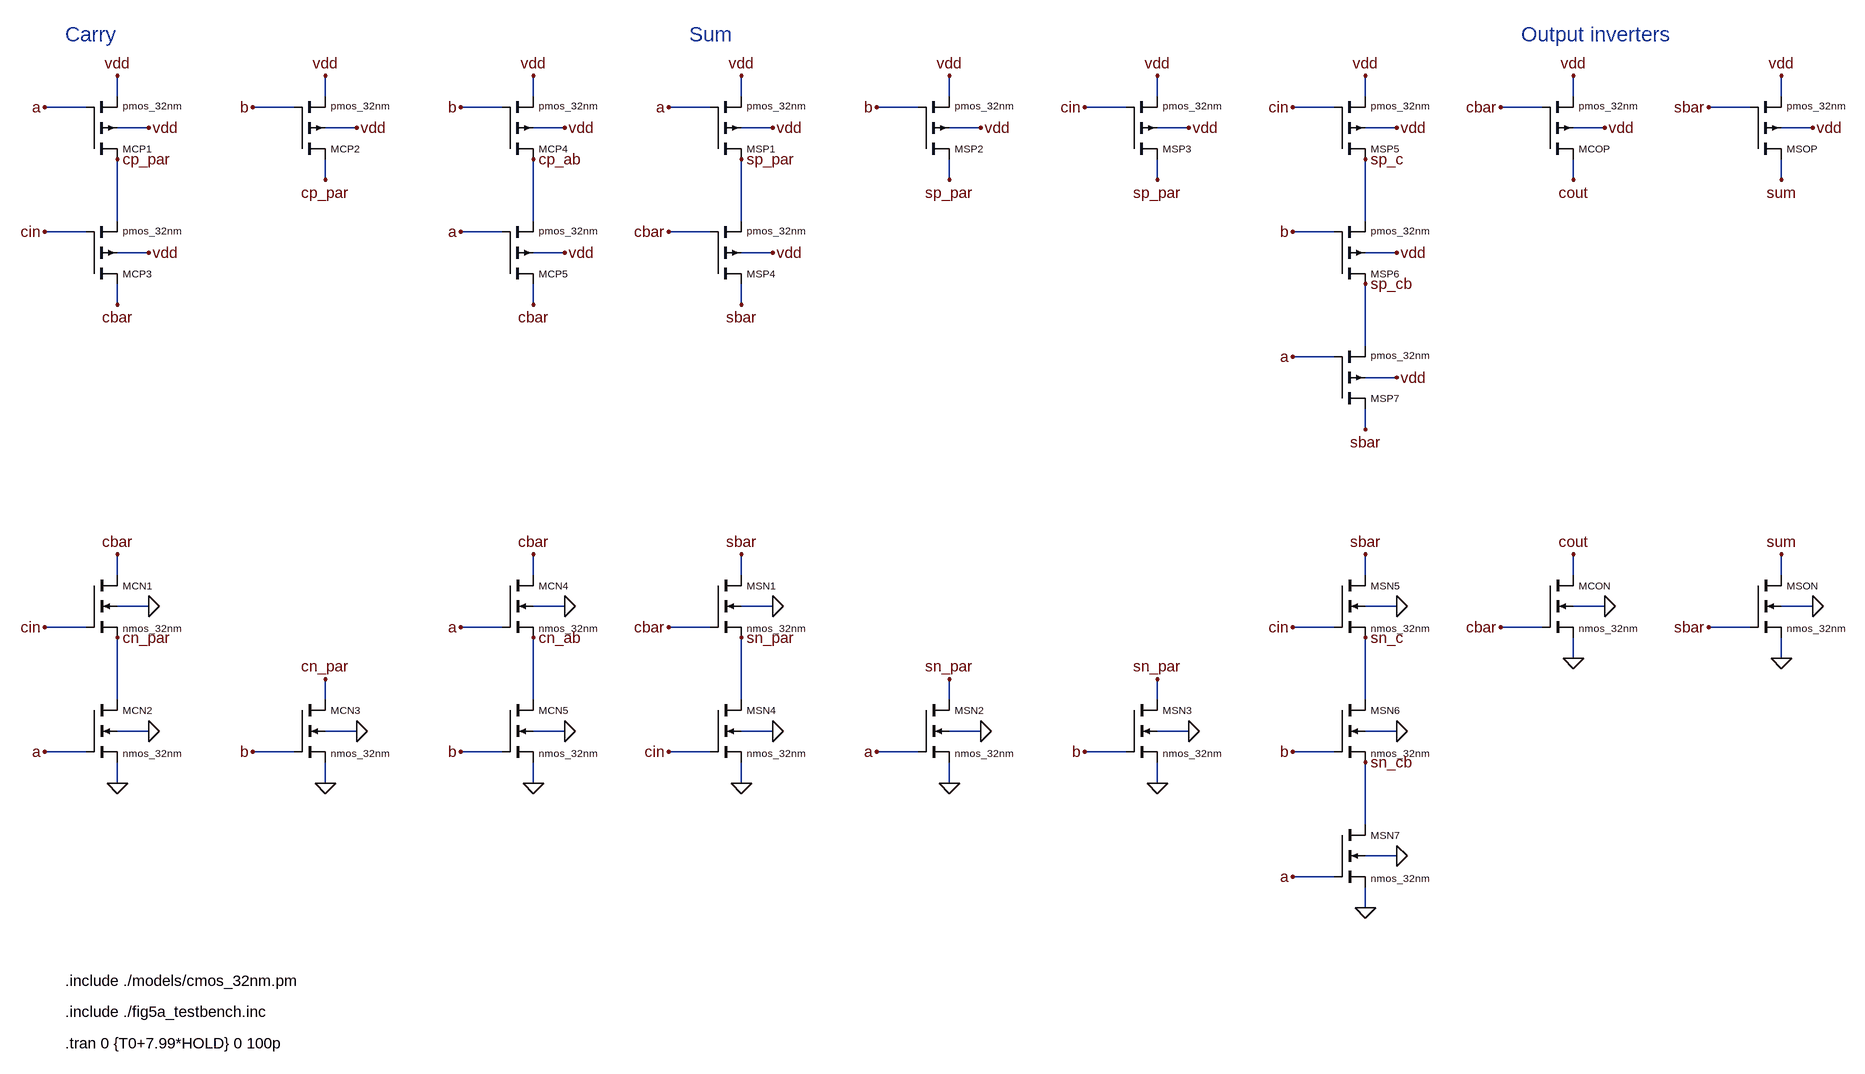
[diagram p0: schematic full_adder_28fet.asc]
full_adder_28fet.asc, the LTspice schematic file:
Version 4
SHEET 1 3040 1672
WIRE 80 144 16 144
WIRE 176 176 128 176
WIRE 128 128 128 96
WIRE 80 336 16 336
WIRE 176 368 128 368
WIRE 128 320 128 224
WIRE 128 448 128 416
WIRE 80 944 16 944
WIRE 176 912 128 912
WIRE 128 864 128 832
WIRE 80 1136 16 1136
WIRE 176 1104 128 1104
WIRE 128 1056 128 960
WIRE 128 1184 128 1152
WIRE 400 144 336 144
WIRE 496 176 448 176
WIRE 448 128 448 96
WIRE 448 256 448 224
WIRE 400 1136 336 1136
WIRE 496 1104 448 1104
WIRE 448 1056 448 1024
WIRE 448 1184 448 1152
WIRE 720 144 656 144
WIRE 816 176 768 176
WIRE 768 128 768 96
WIRE 720 336 656 336
WIRE 816 368 768 368
WIRE 768 320 768 224
WIRE 768 448 768 416
WIRE 720 944 656 944
WIRE 816 912 768 912
WIRE 768 864 768 832
WIRE 720 1136 656 1136
WIRE 816 1104 768 1104
WIRE 768 1056 768 960
WIRE 768 1184 768 1152
WIRE 1040 144 976 144
WIRE 1136 176 1088 176
WIRE 1088 128 1088 96
WIRE 1040 336 976 336
WIRE 1136 368 1088 368
WIRE 1088 320 1088 224
WIRE 1088 448 1088 416
WIRE 1040 944 976 944
WIRE 1136 912 1088 912
WIRE 1088 864 1088 832
WIRE 1040 1136 976 1136
WIRE 1136 1104 1088 1104
WIRE 1088 1056 1088 960
WIRE 1088 1184 1088 1152
WIRE 1360 144 1296 144
WIRE 1456 176 1408 176
WIRE 1408 128 1408 96
WIRE 1408 256 1408 224
WIRE 1360 1136 1296 1136
WIRE 1456 1104 1408 1104
WIRE 1408 1056 1408 1024
WIRE 1408 1184 1408 1152
WIRE 1680 144 1616 144
WIRE 1776 176 1728 176
WIRE 1728 128 1728 96
WIRE 1728 256 1728 224
WIRE 1680 1136 1616 1136
WIRE 1776 1104 1728 1104
WIRE 1728 1056 1728 1024
WIRE 1728 1184 1728 1152
WIRE 2000 144 1936 144
WIRE 2096 176 2048 176
WIRE 2048 128 2048 96
WIRE 2000 336 1936 336
WIRE 2096 368 2048 368
WIRE 2048 320 2048 224
WIRE 2000 528 1936 528
WIRE 2096 560 2048 560
WIRE 2048 512 2048 416
WIRE 2048 640 2048 608
WIRE 2000 944 1936 944
WIRE 2096 912 2048 912
WIRE 2048 864 2048 832
WIRE 2000 1136 1936 1136
WIRE 2096 1104 2048 1104
WIRE 2048 1056 2048 960
WIRE 2000 1328 1936 1328
WIRE 2096 1296 2048 1296
WIRE 2048 1248 2048 1152
WIRE 2048 1376 2048 1344
WIRE 2320 144 2256 144
WIRE 2416 176 2368 176
WIRE 2368 128 2368 96
WIRE 2368 256 2368 224
WIRE 2320 944 2256 944
WIRE 2416 912 2368 912
WIRE 2368 864 2368 832
WIRE 2368 992 2368 960
WIRE 2640 144 2576 144
WIRE 2736 176 2688 176
WIRE 2688 128 2688 96
WIRE 2688 256 2688 224
WIRE 2640 944 2576 944
WIRE 2736 912 2688 912
WIRE 2688 864 2688 832
WIRE 2688 992 2688 960
FLAG 16 144 a
FLAG 176 176 vdd
FLAG 128 96 vdd
FLAG 16 336 cin
FLAG 176 368 vdd
FLAG 128 224 cp_par
FLAG 128 448 cbar
FLAG 16 944 cin
FLAG 176 912 0
FLAG 128 832 cbar
FLAG 16 1136 a
FLAG 176 1104 0
FLAG 128 960 cn_par
FLAG 128 1184 0
FLAG 336 144 b
FLAG 496 176 vdd
FLAG 448 96 vdd
FLAG 448 256 cp_par
FLAG 336 1136 b
FLAG 496 1104 0
FLAG 448 1024 cn_par
FLAG 448 1184 0
FLAG 656 144 b
FLAG 816 176 vdd
FLAG 768 96 vdd
FLAG 656 336 a
FLAG 816 368 vdd
FLAG 768 224 cp_ab
FLAG 768 448 cbar
FLAG 656 944 a
FLAG 816 912 0
FLAG 768 832 cbar
FLAG 656 1136 b
FLAG 816 1104 0
FLAG 768 960 cn_ab
FLAG 768 1184 0
FLAG 976 144 a
FLAG 1136 176 vdd
FLAG 1088 96 vdd
FLAG 976 336 cbar
FLAG 1136 368 vdd
FLAG 1088 224 sp_par
FLAG 1088 448 sbar
FLAG 976 944 cbar
FLAG 1136 912 0
FLAG 1088 832 sbar
FLAG 976 1136 cin
FLAG 1136 1104 0
FLAG 1088 960 sn_par
FLAG 1088 1184 0
FLAG 1296 144 b
FLAG 1456 176 vdd
FLAG 1408 96 vdd
FLAG 1408 256 sp_par
FLAG 1296 1136 a
FLAG 1456 1104 0
FLAG 1408 1024 sn_par
FLAG 1408 1184 0
FLAG 1616 144 cin
FLAG 1776 176 vdd
FLAG 1728 96 vdd
FLAG 1728 256 sp_par
FLAG 1616 1136 b
FLAG 1776 1104 0
FLAG 1728 1024 sn_par
FLAG 1728 1184 0
FLAG 1936 144 cin
FLAG 2096 176 vdd
FLAG 2048 96 vdd
FLAG 1936 336 b
FLAG 2096 368 vdd
FLAG 2048 224 sp_c
FLAG 1936 528 a
FLAG 2096 560 vdd
FLAG 2048 416 sp_cb
FLAG 2048 640 sbar
FLAG 1936 944 cin
FLAG 2096 912 0
FLAG 2048 832 sbar
FLAG 1936 1136 b
FLAG 2096 1104 0
FLAG 2048 960 sn_c
FLAG 1936 1328 a
FLAG 2096 1296 0
FLAG 2048 1152 sn_cb
FLAG 2048 1376 0
FLAG 2256 144 cbar
FLAG 2416 176 vdd
FLAG 2368 96 vdd
FLAG 2368 256 cout
FLAG 2256 944 cbar
FLAG 2416 912 0
FLAG 2368 832 cout
FLAG 2368 992 0
FLAG 2576 144 sbar
FLAG 2736 176 vdd
FLAG 2688 96 vdd
FLAG 2688 256 sum
FLAG 2576 944 sbar
FLAG 2736 912 0
FLAG 2688 832 sum
FLAG 2688 992 0
SYMBOL pmos4 80 224 M180
WINDOW 0 56 16 Left 1
WINDOW 3 56 82 Left 1
SYMATTR InstName MCP1
SYMATTR Value pmos_32nm
SYMATTR Value2 L={LG} W={WP}
SYMBOL pmos4 80 416 M180
WINDOW 0 56 16 Left 1
WINDOW 3 56 82 Left 1
SYMATTR InstName MCP3
SYMATTR Value pmos_32nm
SYMATTR Value2 L={LG} W={WP}
SYMBOL nmos4 80 864 R0
WINDOW 0 56 16 Left 1
WINDOW 3 56 82 Left 1
SYMATTR InstName MCN1
SYMATTR Value nmos_32nm
SYMATTR Value2 L={LG} W={WN}
SYMBOL nmos4 80 1056 R0
WINDOW 0 56 16 Left 1
WINDOW 3 56 82 Left 1
SYMATTR InstName MCN2
SYMATTR Value nmos_32nm
SYMATTR Value2 L={LG} W={WN}
SYMBOL pmos4 400 224 M180
WINDOW 0 56 16 Left 1
WINDOW 3 56 82 Left 1
SYMATTR InstName MCP2
SYMATTR Value pmos_32nm
SYMATTR Value2 L={LG} W={WP}
SYMBOL nmos4 400 1056 R0
WINDOW 0 56 16 Left 1
WINDOW 3 56 82 Left 1
SYMATTR InstName MCN3
SYMATTR Value nmos_32nm
SYMATTR Value2 L={LG} W={WN}
SYMBOL pmos4 720 224 M180
WINDOW 0 56 16 Left 1
WINDOW 3 56 82 Left 1
SYMATTR InstName MCP4
SYMATTR Value pmos_32nm
SYMATTR Value2 L={LG} W={WP}
SYMBOL pmos4 720 416 M180
WINDOW 0 56 16 Left 1
WINDOW 3 56 82 Left 1
SYMATTR InstName MCP5
SYMATTR Value pmos_32nm
SYMATTR Value2 L={LG} W={WP}
SYMBOL nmos4 720 864 R0
WINDOW 0 56 16 Left 1
WINDOW 3 56 82 Left 1
SYMATTR InstName MCN4
SYMATTR Value nmos_32nm
SYMATTR Value2 L={LG} W={WN}
SYMBOL nmos4 720 1056 R0
WINDOW 0 56 16 Left 1
WINDOW 3 56 82 Left 1
SYMATTR InstName MCN5
SYMATTR Value nmos_32nm
SYMATTR Value2 L={LG} W={WN}
SYMBOL pmos4 1040 224 M180
WINDOW 0 56 16 Left 1
WINDOW 3 56 82 Left 1
SYMATTR InstName MSP1
SYMATTR Value pmos_32nm
SYMATTR Value2 L={LG} W={WP}
SYMBOL pmos4 1040 416 M180
WINDOW 0 56 16 Left 1
WINDOW 3 56 82 Left 1
SYMATTR InstName MSP4
SYMATTR Value pmos_32nm
SYMATTR Value2 L={LG} W={WP}
SYMBOL nmos4 1040 864 R0
WINDOW 0 56 16 Left 1
WINDOW 3 56 82 Left 1
SYMATTR InstName MSN1
SYMATTR Value nmos_32nm
SYMATTR Value2 L={LG} W={WN}
SYMBOL nmos4 1040 1056 R0
WINDOW 0 56 16 Left 1
WINDOW 3 56 82 Left 1
SYMATTR InstName MSN4
SYMATTR Value nmos_32nm
SYMATTR Value2 L={LG} W={WN}
SYMBOL pmos4 1360 224 M180
WINDOW 0 56 16 Left 1
WINDOW 3 56 82 Left 1
SYMATTR InstName MSP2
SYMATTR Value pmos_32nm
SYMATTR Value2 L={LG} W={WP}
SYMBOL nmos4 1360 1056 R0
WINDOW 0 56 16 Left 1
WINDOW 3 56 82 Left 1
SYMATTR InstName MSN2
SYMATTR Value nmos_32nm
SYMATTR Value2 L={LG} W={WN}
SYMBOL pmos4 1680 224 M180
WINDOW 0 56 16 Left 1
WINDOW 3 56 82 Left 1
SYMATTR InstName MSP3
SYMATTR Value pmos_32nm
SYMATTR Value2 L={LG} W={WP}
SYMBOL nmos4 1680 1056 R0
WINDOW 0 56 16 Left 1
WINDOW 3 56 82 Left 1
SYMATTR InstName MSN3
SYMATTR Value nmos_32nm
SYMATTR Value2 L={LG} W={WN}
SYMBOL pmos4 2000 224 M180
WINDOW 0 56 16 Left 1
WINDOW 3 56 82 Left 1
SYMATTR InstName MSP5
SYMATTR Value pmos_32nm
SYMATTR Value2 L={LG} W={WP}
SYMBOL pmos4 2000 416 M180
WINDOW 0 56 16 Left 1
WINDOW 3 56 82 Left 1
SYMATTR InstName MSP6
SYMATTR Value pmos_32nm
SYMATTR Value2 L={LG} W={WP}
SYMBOL pmos4 2000 608 M180
WINDOW 0 56 16 Left 1
WINDOW 3 56 82 Left 1
SYMATTR InstName MSP7
SYMATTR Value pmos_32nm
SYMATTR Value2 L={LG} W={WP}
SYMBOL nmos4 2000 864 R0
WINDOW 0 56 16 Left 1
WINDOW 3 56 82 Left 1
SYMATTR InstName MSN5
SYMATTR Value nmos_32nm
SYMATTR Value2 L={LG} W={WN}
SYMBOL nmos4 2000 1056 R0
WINDOW 0 56 16 Left 1
WINDOW 3 56 82 Left 1
SYMATTR InstName MSN6
SYMATTR Value nmos_32nm
SYMATTR Value2 L={LG} W={WN}
SYMBOL nmos4 2000 1248 R0
WINDOW 0 56 16 Left 1
WINDOW 3 56 82 Left 1
SYMATTR InstName MSN7
SYMATTR Value nmos_32nm
SYMATTR Value2 L={LG} W={WN}
SYMBOL pmos4 2320 224 M180
WINDOW 0 56 16 Left 1
WINDOW 3 56 82 Left 1
SYMATTR InstName MCOP
SYMATTR Value pmos_32nm
SYMATTR Value2 L={LG} W={WPI_COUT}
SYMBOL nmos4 2320 864 R0
WINDOW 0 56 16 Left 1
WINDOW 3 56 82 Left 1
SYMATTR InstName MCON
SYMATTR Value nmos_32nm
SYMATTR Value2 L={LG} W={WNI}
SYMBOL pmos4 2640 224 M180
WINDOW 0 56 16 Left 1
WINDOW 3 56 82 Left 1
SYMATTR InstName MSOP
SYMATTR Value pmos_32nm
SYMATTR Value2 L={LG} W={WPI_SUM}
SYMBOL nmos4 2640 864 R0
WINDOW 0 56 16 Left 1
WINDOW 3 56 82 Left 1
SYMATTR InstName MSON
SYMATTR Value nmos_32nm
SYMATTR Value2 L={LG} W={WNI}
TEXT 48 32 Left 3 ;Carry
TEXT 1008 32 Left 3 ;Sum
TEXT 2288 32 Left 3 ;Output inverters
TEXT 48 1488 Left 2 !.include ./models/cmos_32nm.pm
TEXT 48 1536 Left 2 !.include ./fig5a_testbench.inc
TEXT 48 1584 Left 2 !.tran 0 {T0+7.99*HOLD} 0 100p

The netlist it stands for:
* full_adder_28fet.asc
MCP1 cp_par a vdd vdd pmos_32nm L={LG} W={WP}
MCP3 cbar cin cp_par vdd pmos_32nm L={LG} W={WP}
MCN1 cbar cin cn_par 0 nmos_32nm L={LG} W={WN}
MCN2 cn_par a 0 0 nmos_32nm L={LG} W={WN}
MCP2 cp_par b vdd vdd pmos_32nm L={LG} W={WP}
MCN3 cn_par b 0 0 nmos_32nm L={LG} W={WN}
MCP4 cp_ab b vdd vdd pmos_32nm L={LG} W={WP}
MCP5 cbar a cp_ab vdd pmos_32nm L={LG} W={WP}
MCN4 cbar a cn_ab 0 nmos_32nm L={LG} W={WN}
MCN5 cn_ab b 0 0 nmos_32nm L={LG} W={WN}
MSP1 sp_par a vdd vdd pmos_32nm L={LG} W={WP}
MSP4 sbar cbar sp_par vdd pmos_32nm L={LG} W={WP}
MSN1 sbar cbar sn_par 0 nmos_32nm L={LG} W={WN}
MSN4 sn_par cin 0 0 nmos_32nm L={LG} W={WN}
MSP2 sp_par b vdd vdd pmos_32nm L={LG} W={WP}
MSN2 sn_par a 0 0 nmos_32nm L={LG} W={WN}
MSP3 sp_par cin vdd vdd pmos_32nm L={LG} W={WP}
MSN3 sn_par b 0 0 nmos_32nm L={LG} W={WN}
MSP5 sp_c cin vdd vdd pmos_32nm L={LG} W={WP}
MSP6 sp_cb b sp_c vdd pmos_32nm L={LG} W={WP}
MSP7 sbar a sp_cb vdd pmos_32nm L={LG} W={WP}
MSN5 sbar cin sn_c 0 nmos_32nm L={LG} W={WN}
MSN6 sn_c b sn_cb 0 nmos_32nm L={LG} W={WN}
MSN7 sn_cb a 0 0 nmos_32nm L={LG} W={WN}
MCOP cout cbar vdd vdd pmos_32nm L={LG} W={WPI_COUT}
MCON cout cbar 0 0 nmos_32nm L={LG} W={WNI}
MSOP sum sbar vdd vdd pmos_32nm L={LG} W={WPI_SUM}
MSON sum sbar 0 0 nmos_32nm L={LG} W={WNI}
.model NMOS NMOS
.model PMOS PMOS
.lib standard.mos
* Carry
* Sum
* Output inverters
.include ./models/cmos_32nm.pm
.include ./fig5a_testbench.inc
.tran 0 {T0+7.99*HOLD} 0 100p
.backanno
.end